# EAGLE design Crowtail- Moisture Sensor v1.0 (EAGLE 6.3)
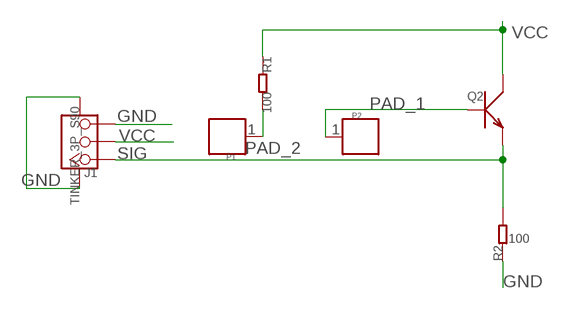
[diagram p0: schematic, sheet 1]

## Parts
J1  TINKER_3P_S90  [TINKER_3P_S90]
P1  PAD.03  [1P-SMD-0.76X0.76]
P2  PAD.03  [1P-SMD-0.76X0.76]
Q2  TRANSISTOR-NPN-SOT23''  [SOT23]
R1  100  R-0603  [0603]
R2  100  R-0603  [0603]

## Nets
GND: J1.3 J1.SS1 J1.SS2 R2.1
PAD_1: P2.1 Q2.1(B)
PAD_2: P1.1 R1.2
SIG: J1.1 Q2.2(E) R2.2
VCC: J1.2 Q2.3(C) R1.1

## Library data of the parts
J1 = Connector:TINKER_3P_S90
P1 P2 = Discrete:PAD
Q2 = Discrete:TRANSISTOR-NPN*: NPN audion
R1 R2 = Discrete:R*

## Board
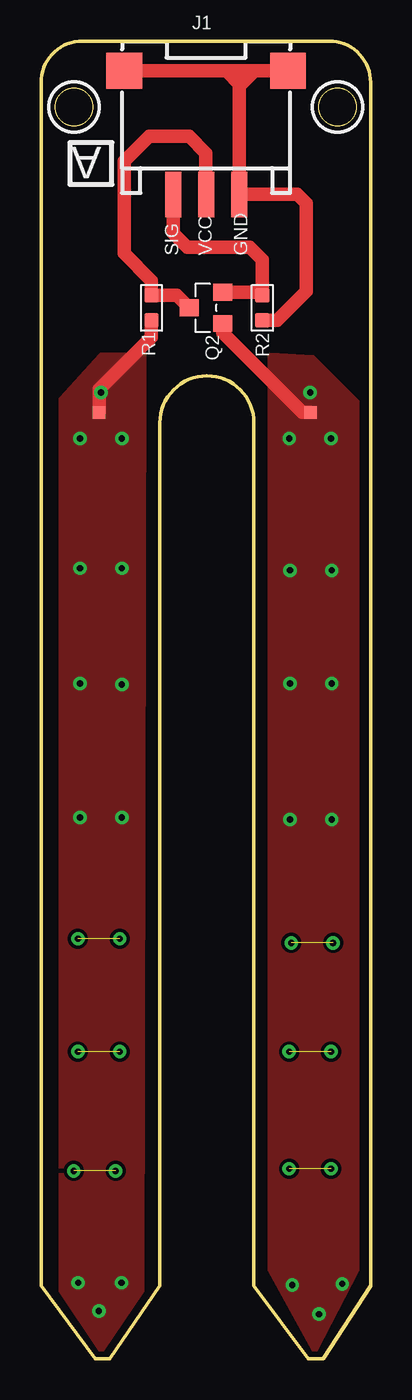
[diagram p1: board, top side]
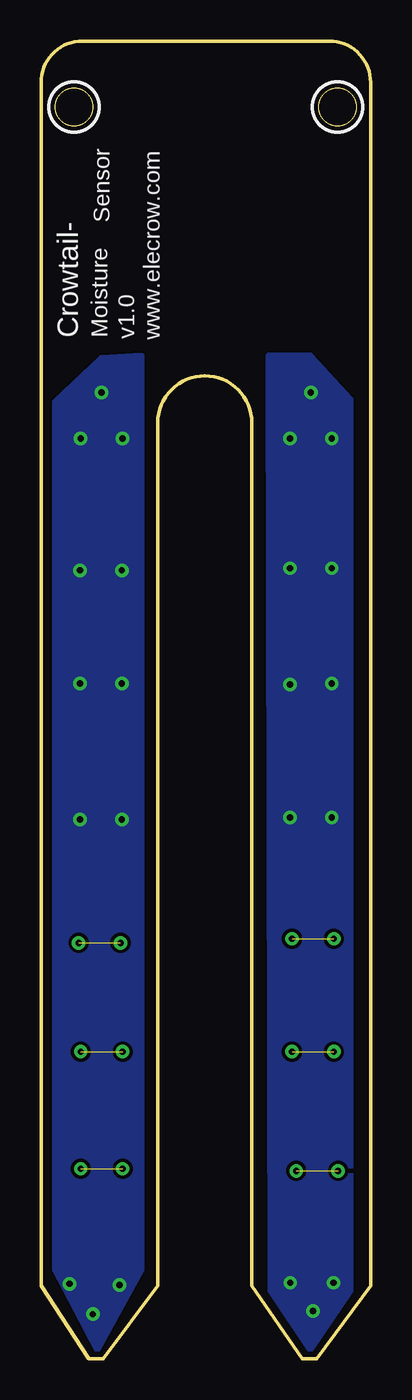
[diagram p2: board, bottom side, seen from below]

Size 20 x 80 mm. Coordinates in mm from the lower left corner, seen from the top.
Outline: 0,4.44 0,77.5 arc-90 2.5,80 17.5,80 arc-90 20,77.5 20,4.44 17.11,0 16.22,0 12.92,4.44 12.92,56.83 arc180 7.21,56.83 7.21,4.44 4.16,0 3.27,0 0,4.44
Outline: circle at 2,76 radius 1.14
Outline: circle at 18,76 radius 1.14
Copper layers (1*16): Top 0.035mm / dielectric 1.5mm / Bottom 0.035mm
Design rules "default *": minimum track width 10mil, minimum drill 12mil, track to track 8mil, track to pad 8mil, pad to pad 8mil, via to via 8mil, smd to smd 8mil, copper to edge 0mil, drill to drill 8mil, minimum pad ring 10mil, minimum via ring 8mil, stop-mask expansion 4mil, vias tented up to drill 25mil, thermal gap 10mil
tRestrict: area 0.5,74.5 to 3.5,77.5; area 16.5,74.5 to 19.5,77.5
bRestrict: area 0.5,74.5 to 3.5,77.5; area 16.5,74.5 to 19.5,77.5

### Footprints (pad centres in the part's own frame; a part is rotated, then mirrored left to right if it is on the bottom)
TINKER_3P_S90 = smd 0.965 x 2.74: 1 -1.984,-4.545; 2 0.016,-4.545; 3 2.016,-4.545 | smd 2.159 x 2.184: SS1 -4.958,2.955; SS2 4.99,2.955
1P-SMD-0.76X0.76 = smd 0.762 x 0.762: 1 0,0
SOT23 = smd 1.016 x 1.143: 1 -0.95,-1.016; 2 0.95,-1.016; 3 0,1.016
0603 = smd 0.889 x 0.889: 1 -0.762,0; 2 0.762,0

### Placement (x,y rotation side)
J1  10,75.24 0 top
P1  3.52,57.46 0 top
P2  16.35,57.46 0 top
Q2  10,63.81 90 top
R1  6.7,63.81 270 top
R2  13.43,63.81 90 top

### Tracks (layer width: path | path; a pad name or v marks a point on that pad's centre or on a via)
GND
  Top 0.813: R2.1 14.32,63.05 16.1,64.83 16.1,70.16 15.56,70.69 J1.3 12.03,70.71 12.03,77.27 12.96,78.19 J1.SS2 J1.SS1
N$1
  Top 0.813: 11.27,78.16 12.03,77.4
PAD_1  (via drill 0.38 pad 0.81)
  Top 0.813: P2.1 15.84,57.46 11.02,62.29 Q2.1
  other vias: 15.25,4.49 16.87,2.71 18.28,4.55 15.06,55.87 15.1,47.87 15.1,41 15.1,32.75 17.64,32.75 17.64,41 17.64,47.87 17.6,55.87 16.33,58.67
  pour Top (no thermals): 13.94,5.4 13.94,60.89 16.48,60.76 19.14,58.09 19.14,5.4 16.6,0.56
  pour Bottom (no thermals): 13.94,5.4 13.94,60.89 16.35,60.76 19.14,58.09 19.14,5.4 16.6,0.56
PAD_2  (via drill 0.38 pad 0.81)
  Top 0.813: 3.52,58.35 P1.1 3.52,58.86 6.7,62.03 R1.2
  other vias: 2.25,4.62 4.88,4.62 2.36,32.87 3.5,2.9 3.63,58.67 4.9,32.87 4.9,40.94 2.36,41 4.9,48 2.36,48 4.9,55.87 2.36,55.87
  pour Top (no thermals): 1.24,58.27 3.65,60.89 6.19,60.89 6.06,4.12 3.65,0.56 1.24,4.12
  pour Bottom (no thermals): 1.24,58.27 3.65,60.89 6.19,60.89 6.06,4.12 3.65,0.56 1.24,4.12
PAD_3  (via drill 0.38 pad 0.81)  (1 unrouted)
  other vias: 2.23,25.51 4.77,25.51
PAD_4  (via drill 0.38 pad 0.81)  (1 unrouted)
  other vias: 2.23,18.65 4.77,18.65
PAD_5  (via drill 0.38 pad 0.81)  (1 unrouted)
  other vias: 1.98,11.41 4.52,11.41
PAD_6  (via drill 0.38 pad 0.81)  (1 unrouted)
  other vias: 15.18,25.25 17.72,25.25
PAD_7  (via drill 0.38 pad 0.81)  (1 unrouted)
  other vias: 15.06,18.65 17.6,18.65
PAD_8  (via drill 0.38 pad 0.81)  (1 unrouted)
  other vias: 15.06,11.54 17.6,11.54
SIG
  Top 0.813: 13.43,65.08 13.43,66.73 12.67,67.49 8.86,67.49 8.02,68.33 J1.1 | 13.43,65.08 R2.2 | Q2.2 13.11,64.76 13.43,65.08
VCC
  Top 0.813: J1.2 10,70.68 10,73.21 8.98,74.22 6.57,74.22 5.05,72.7 5.05,67.11 6.7,65.46 R1.1 8.22,64.57 Q2.3

### Text on the board
tPlace: A | SIG | VCC | GND
bPlace: Sensor | www.elecrow.com | v1.0 | Moisture | Crowtail-